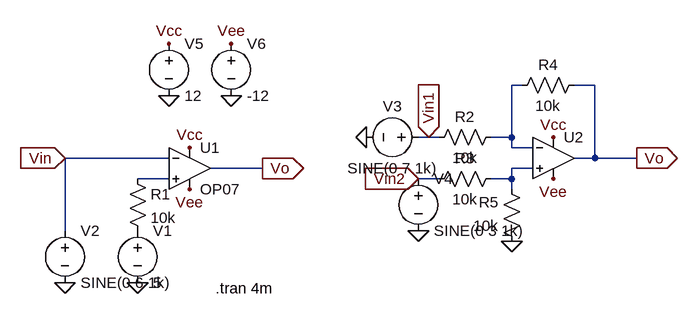
[diagram p0: schematic Draft1.asc]
Draft1.asc, the LTspice schematic file:
Version 4.1
SHEET 1 880 680
WIRE 608 -80 592 -80
WIRE 720 -80 688 -80
WIRE 464 0 448 0
WIRE 480 0 464 0
WIRE 592 0 592 -80
WIRE 592 0 560 0
WIRE 592 16 592 0
WIRE 624 16 592 16
WIRE 64 32 -96 32
WIRE 720 32 720 -80
WIRE 720 32 688 32
WIRE 784 32 720 32
WIRE 208 48 128 48
WIRE 624 48 592 48
WIRE 64 64 16 64
WIRE 480 64 448 64
WIRE 592 64 592 48
WIRE 592 64 560 64
WIRE 592 80 592 64
WIRE -96 144 -96 32
FLAG -96 224 0
FLAG 16 224 0
FLAG -96 32 Vin
IOPIN -96 32 In
FLAG 208 48 Vo
IOPIN 208 48 Out
FLAG 64 -64 0
FLAG 160 -64 0
FLAG 64 -144 Vcc
FLAG 160 -144 Vee
FLAG 96 80 Vee
FLAG 96 16 Vcc
FLAG 368 0 0
FLAG 448 144 0
FLAG 592 160 0
FLAG 656 0 Vcc
FLAG 656 64 Vee
FLAG 464 0 Vin1
IOPIN 464 0 In
FLAG 448 64 Vin2
IOPIN 448 64 In
FLAG 784 32 Vo
IOPIN 784 32 Out
SYMBOL res 0 48 R0
SYMATTR InstName R1
SYMATTR Value 10k
SYMBOL voltage 16 128 R0
WINDOW 123 0 0 Left 0
WINDOW 39 0 0 Left 0
SYMATTR InstName V1
SYMATTR Value 5
SYMBOL voltage -96 128 R0
WINDOW 123 0 0 Left 0
WINDOW 39 0 0 Left 0
SYMATTR InstName V2
SYMATTR Value SINE(0 6 1k)
SYMBOL OpAmps\\OP07 96 -16 R0
SYMATTR InstName U1
SYMBOL voltage 64 -160 R0
WINDOW 123 0 0 Left 0
WINDOW 39 0 0 Left 0
SYMATTR InstName V5
SYMATTR Value 12
SYMBOL voltage 160 -160 R0
WINDOW 123 0 0 Left 0
WINDOW 39 0 0 Left 0
SYMATTR InstName V6
SYMATTR Value -12
SYMBOL OpAmps\\UniversalOpAmp2 656 32 R0
SYMATTR InstName U2
SYMBOL res 576 -16 R90
WINDOW 0 0 56 VBottom 2
WINDOW 3 32 56 VTop 2
SYMATTR InstName R2
SYMATTR Value 10k
SYMBOL res 576 48 R90
WINDOW 0 0 56 VBottom 2
WINDOW 3 32 56 VTop 2
SYMATTR InstName R3
SYMATTR Value 10k
SYMBOL res 704 -96 R90
WINDOW 0 0 56 VBottom 2
WINDOW 3 32 56 VTop 2
SYMATTR InstName R4
SYMATTR Value 10k
SYMBOL res 608 176 R180
WINDOW 0 36 76 Left 2
WINDOW 3 36 40 Left 2
SYMATTR InstName R5
SYMATTR Value 10k
SYMBOL voltage 464 0 R90
WINDOW 0 -32 56 VBottom 2
WINDOW 3 32 56 VTop 2
WINDOW 123 0 0 Left 0
WINDOW 39 0 0 Left 0
SYMATTR InstName V3
SYMATTR Value SINE(0 7 1k)
SYMBOL voltage 448 48 R0
WINDOW 123 0 0 Left 0
WINDOW 39 0 0 Left 0
SYMATTR InstName V4
SYMATTR Value SINE(0 3 1k)
TEXT 136 232 Left 2 !.tran 4m

The netlist it stands for:
* Draft1.asc
R1 N003 P001 10k
V1 P001 0 5
V2 Vin 0 SINE(0 6 1k)
X§U1 N003 Vin Vcc Vee Vo LT1001  ; OP07, pins In+ In- V+ V- OUT
V5 Vcc 0 12
V6 Vee 0 -12
X§U2 N002 N001 Vcc Vee Vo level2 Avol=1Meg GBW=10Meg Slew=10Meg Ilimit=25m Rail=0 Vos=0 En=0 Enk=0 In=0 Ink=0 Rin=500Meg  ; pins In+ In- V+ V- OUT
R2 N001 Vin1 10k
R3 N002 Vin2 10k
R4 Vo N001 10k
R5 0 N002 10k
V3 Vin1 0 SINE(0 7 1k)
V4 Vin2 0 SINE(0 3 1k)
.tran 4m
.lib LTC.lib
.lib UniversalOpAmp2.lib
.backanno
.end